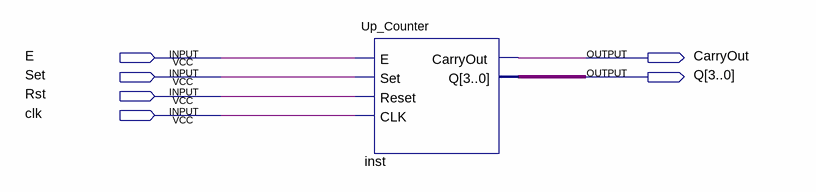
[diagram p0: schematic sheet]
// Quartus schematic test_counter.bdf as structural Verilog: 1 symbols, 6 pins
module test_counter (
  input  E,
  input  Set,
  input  Rst,
  input  clk,
  output CarryOut,
  output [3:0] Q
);

  Up_Counter inst (.E(E), .Set(Set), .Reset(Rst), .CLK(clk), .CarryOut(CarryOut), .Q(Q));
endmodule
